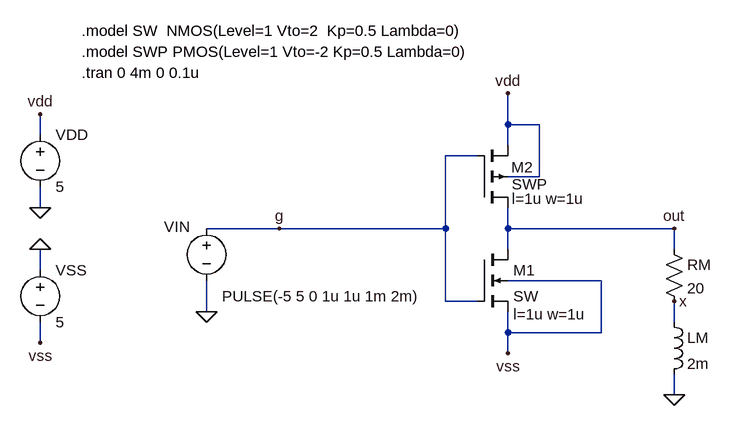
[diagram p0: schematic Ex10.asc]
Ex10.asc, the LTspice schematic file:
Version 4.1
SHEET 1 1200 800
WIRE 240 -64 240 -112
WIRE 288 -64 240 -64
WIRE -480 -48 -480 -80
WIRE 240 -32 240 -64
WIRE 192 -16 144 -16
WIRE 288 16 288 -64
WIRE 288 16 240 16
WIRE -480 64 -480 32
WIRE -112 96 -224 96
WIRE 144 96 144 -16
WIRE 144 96 -112 96
WIRE 240 96 240 64
WIRE 496 96 240 96
WIRE 240 128 240 96
WIRE 496 128 496 96
WIRE -480 160 -480 128
WIRE 384 176 240 176
WIRE 144 208 144 96
WIRE 192 208 144 208
WIRE -224 224 -224 176
WIRE 496 240 496 208
WIRE 240 256 240 224
WIRE 384 256 384 176
WIRE 384 256 240 256
WIRE -480 272 -480 240
WIRE 240 288 240 256
WIRE 496 352 496 320
FLAG 240 -112 vdd
FLAG 240 288 vss
FLAG 496 96 out
FLAG -112 96 g
FLAG 496 352 0
FLAG -224 224 0
FLAG -480 -80 vdd
FLAG -480 64 0
FLAG -480 128 0
FLAG -480 272 vss
FLAG 496 208 x
SYMBOL pmos4 192 64 M180
WINDOW 39 54 14 Left 2
WINDOW 0 53 62 Left 2
WINDOW 3 54 36 Left 2
SYMATTR SpiceLine l=1u w=1u
SYMATTR InstName M2
SYMATTR Value SWP
SYMBOL nmos4 192 128 R0
WINDOW 39 56 100 Left 2
SYMATTR SpiceLine l=1u w=1u
SYMATTR InstName M1
SYMATTR Value SW
SYMBOL res 480 112 R0
SYMATTR InstName RM
SYMATTR Value 20
SYMBOL ind 480 224 R0
SYMATTR InstName LM
SYMATTR Value 2m
SYMBOL voltage -224 80 R0
WINDOW 123 0 0 Left 0
WINDOW 39 0 0 Left 0
WINDOW 3 24 120 Left 2
WINDOW 0 -65 13 Left 2
SYMATTR Value PULSE(-5 5 0 1u 1u 1m 2m)
SYMATTR InstName VIN
SYMBOL voltage -480 -64 R0
SYMATTR InstName VDD
SYMATTR Value 5
SYMBOL voltage -480 144 R0
SYMATTR InstName VSS
SYMATTR Value 5
TEXT -416 -208 Left 2 !.model SW  NMOS(Level=1 Vto=2  Kp=0.5 Lambda=0)
TEXT -416 -176 Left 2 !.model SWP PMOS(Level=1 Vto=-2 Kp=0.5 Lambda=0)
TEXT -416 -144 Left 2 !.tran 0 4m 0 0.1u

The netlist it stands for:
* Ex10.asc
M2 out g vdd vdd SWP l=1u w=1u
M1 out g vss vss SW l=1u w=1u
RM out x 20
LM x 0 2m
VIN g 0 PULSE(-5 5 0 1u 1u 1m 2m)
VDD vdd 0 5
VSS 0 vss 5
.model NMOS NMOS
.model PMOS PMOS
.lib standard.mos
.model SW  NMOS(Level=1 Vto=2  Kp=0.5 Lambda=0)
.model SWP PMOS(Level=1 Vto=-2 Kp=0.5 Lambda=0)
.tran 0 4m 0 0.1u
.backanno
.end